# EAGLE schematic MAVI_PCB_ESQUEMATICO (EAGLE 9.7.0)
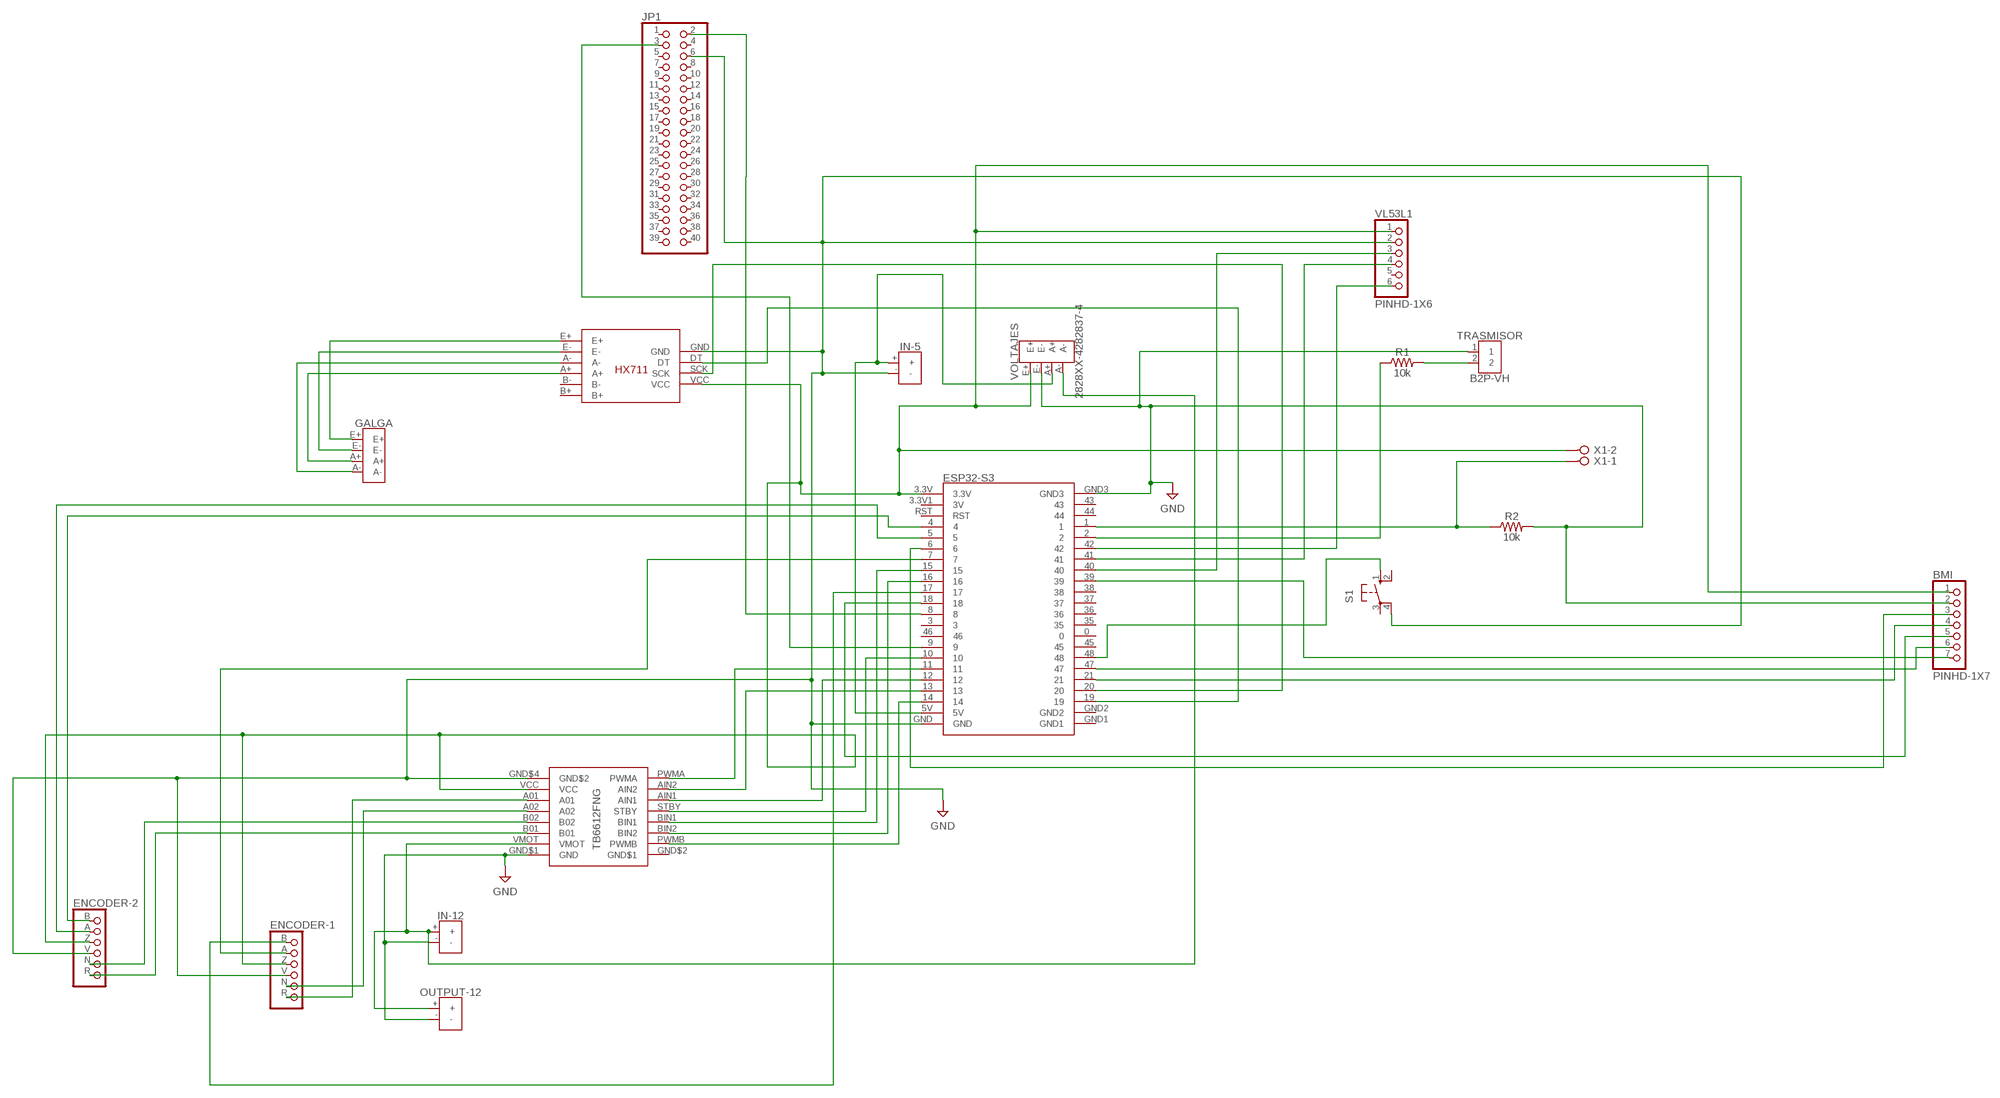
[diagram p0: schematic, sheet 1]

## Parts
BMI  PINHD-1X7  [1X07]
ENCODER-1  ENCODER  [1X06]
ENCODER-2  ENCODER  [1X06]
GALGA  CC282837-4  [TERMBLK_508-4N]
IN-5  VOLTAJE282837-2  [TERMBLK_508-2N]
IN-12  VOLTAJE282837-2  [TERMBLK_508-2N]
JP1  PINHD-2X20  [2X20]
OUTPUT-12  VOLTAJE282837-2  [TERMBLK_508-2N]
R1  10k  10KOHM-HORIZ-1/4W-1%  [AXIAL-0.3]
R2  10k  10KOHM-HORIZ-1/4W-1%  [AXIAL-0.3]
S1  10-XX  [B3F-10XX]
TRASMISOR  B2P-VH  [B2P-VH_396-2N]
U$1  TB6612DEFINITIVO  [TB6612FNG]
U$2  ESP32-S2  [ESP32-S3]
U$3  HX711  [HX711]
VL53L1  PINHD-1X6  [1X06]
VOLTAJES  2828XX-4282837-4  [TERMBLK_508-4N]
X1  W237-02P  [W237-132]

## Nets
GND: BMI.2 ENCODER-1.V ENCODER-2.V IN-5.- IN-12.- JP1.6 OUTPUT-12.- R2.P$2 S1.4(P1) TRASMISOR.1 U$1.GND$1(GND) U$1.GND$4(GND$2) U$2.GND U$2.GND3 U$3.GND VL53L1.2 VOLTAJES.E-
N$1: GALGA.E+ U$3.E+
N$2: GALGA.E- U$3.E-
N$3: GALGA.A+ U$3.A+
N$4: GALGA.A- U$3.A-
N$6: IN-12.+ OUTPUT-12.+ U$1.VMOT VOLTAJES.A-
N$7: BMI.1 ENCODER-1.Z ENCODER-2.Z U$1.VCC U$2.3.3V U$3.VCC VL53L1.1 VOLTAJES.E+ X1.2
N$8: U$2.19 U$3.DT
N$10: ENCODER-1.R U$1.A01
N$11: ENCODER-1.N U$1.A02
N$12: ENCODER-2.N U$1.B02
N$13: ENCODER-2.R U$1.B01
N$14: U$1.PWMA U$2.11
N$15: U$1.AIN2 U$2.13
N$16: U$1.AIN1 U$2.12
N$17: U$1.STBY U$2.10
N$18: U$1.BIN1 U$2.15
N$19: U$1.BIN2 U$2.16
N$20: U$1.PWMB U$2.14
N$21: JP1.3 U$2.9
N$22: JP1.2 U$2.8
N$23: ENCODER-2.B U$2.4
N$24: ENCODER-2.A U$2.5
N$25: ENCODER-1.B U$2.17
N$26: ENCODER-1.A U$2.7
N$28: U$2.20 U$3.SCK
N$29: U$2.40 VL53L1.3
N$30: U$2.41 VL53L1.4
N$31: U$2.42 VL53L1.6
N$32: R1.P$1 U$2.2
N$33: R1.P$2 TRASMISOR.2
N$34: R2.P$1 U$2.1 X1.1
N$35: BMI.3 U$2.6
N$36: IN-5.+ U$2.5V VOLTAJES.A+
N$37: BMI.4 U$2.21
N$38: BMI.5 U$2.18
N$39: BMI.6 U$2.47
N$40: BMI.7 U$2.39
N$41: S1.1(S) U$2.48
Unconnected: JP1.1 JP1.4 JP1.5 JP1.7 JP1.8 JP1.9 JP1.10 JP1.11 JP1.12 JP1.13 JP1.14 JP1.15 JP1.16 JP1.17 JP1.18 JP1.19 JP1.20 JP1.21 JP1.22 JP1.23 JP1.24 JP1.25 JP1.26 JP1.27 JP1.28 JP1.29 JP1.30 JP1.31 JP1.32 JP1.33 JP1.34 JP1.35 JP1.36 JP1.37 JP1.38 JP1.39 JP1.40 S1.2(S1) S1.3(P) U$1.GND$2(GND$1) U$2.0 U$2.3 U$2.3.3V1(3V) U$2.35 U$2.36 U$2.37 U$2.38 U$2.43 U$2.44 U$2.45 U$2.46 U$2.GND1 U$2.GND2 U$2.RST U$3.B+ U$3.B- VL53L1.5

## Library data of the parts
BMI = Connector:PINHD-1X7: PIN HEADER
ENCODER-1 ENCODER-2 = Connector:ENCODER: PIN HEADER
GALGA = Connector:CC: 4 Position Wire to Board Terminal Block Horizontal with Board Datasheet <https://www.te.com.cn/commerce/DocumentDelivery/DDEController?Action=showdoc&DocId=Catalog+Section%7F1308389_EUROSTYLE_TERMINAL_BLOCKS%7F0607%7Fpdf%7FEnglish%7FENG_CS_1308389_EUROSTYLE_TERMINAL_BLOCKS_0607.pdf%7F2-282837-5>
IN-5 IN-12 OUTPUT-12 = Connector:VOLTAJE: 2 Position Wire to Board Terminal Block Horizontal with Board Datasheet <https://www.te.com.cn/commerce/DocumentDelivery/DDEController?Action=showdoc&DocId=Catalog+Section%7F1308389_EUROSTYLE_TERMINAL_BLOCKS%7F0607%7Fpdf%7FEnglish%7FENG_CS_1308389_EUROSTYLE_TERMINAL_BLOCKS_0607.pdf%7F2-282837-5>
JP1 = Connector:PINHD-2X20: PIN HEADER
R1 R2 = SparkFun-Resistors:10KOHM: 10kΩ resistor A resistor is a passive two-terminal electrical component that implements electrical resistance as a circuit element. Resistors act to reduce current flow, and, at the same time, act to lower voltage levels within circuits. - Wikipedia
S1 = PulseOximeterECG_AU:10-XX: OMRON SWITCH
TRASMISOR = Connector:B2P-VH: VH Connector Top Entry - 2POS-3.96MM Details see: Datasheet <http://www.jst-mfg.com/product/pdf/eng/eVH.pdf>
U$1 = tb6612FNG:TB6612DEFINITIVO
U$2 = ESP32-S3:ESP32-S2
U$3 = Biblioteca:HX711
VL53L1 = Connector:PINHD-1X6: PIN HEADER
VOLTAJES = Connector:2828XX-4: 4 Position Wire to Board Terminal Block Horizontal with Board Datasheet <https://www.te.com.cn/commerce/DocumentDelivery/DDEController?Action=showdoc&DocId=Catalog+Section%7F1308389_EUROSTYLE_TERMINAL_BLOCKS%7F0607%7Fpdf%7FEnglish%7FENG_CS_1308389_EUROSTYLE_TERMINAL_BLOCKS_0607.pdf%7F2-282837-5>
X1 = con-wago-508:W237-02P: WAGO SREW CLAMP